# Altium schematic sheet PCB.SchDoc
size A; SheetNumber: 1; SheetTotal: 1
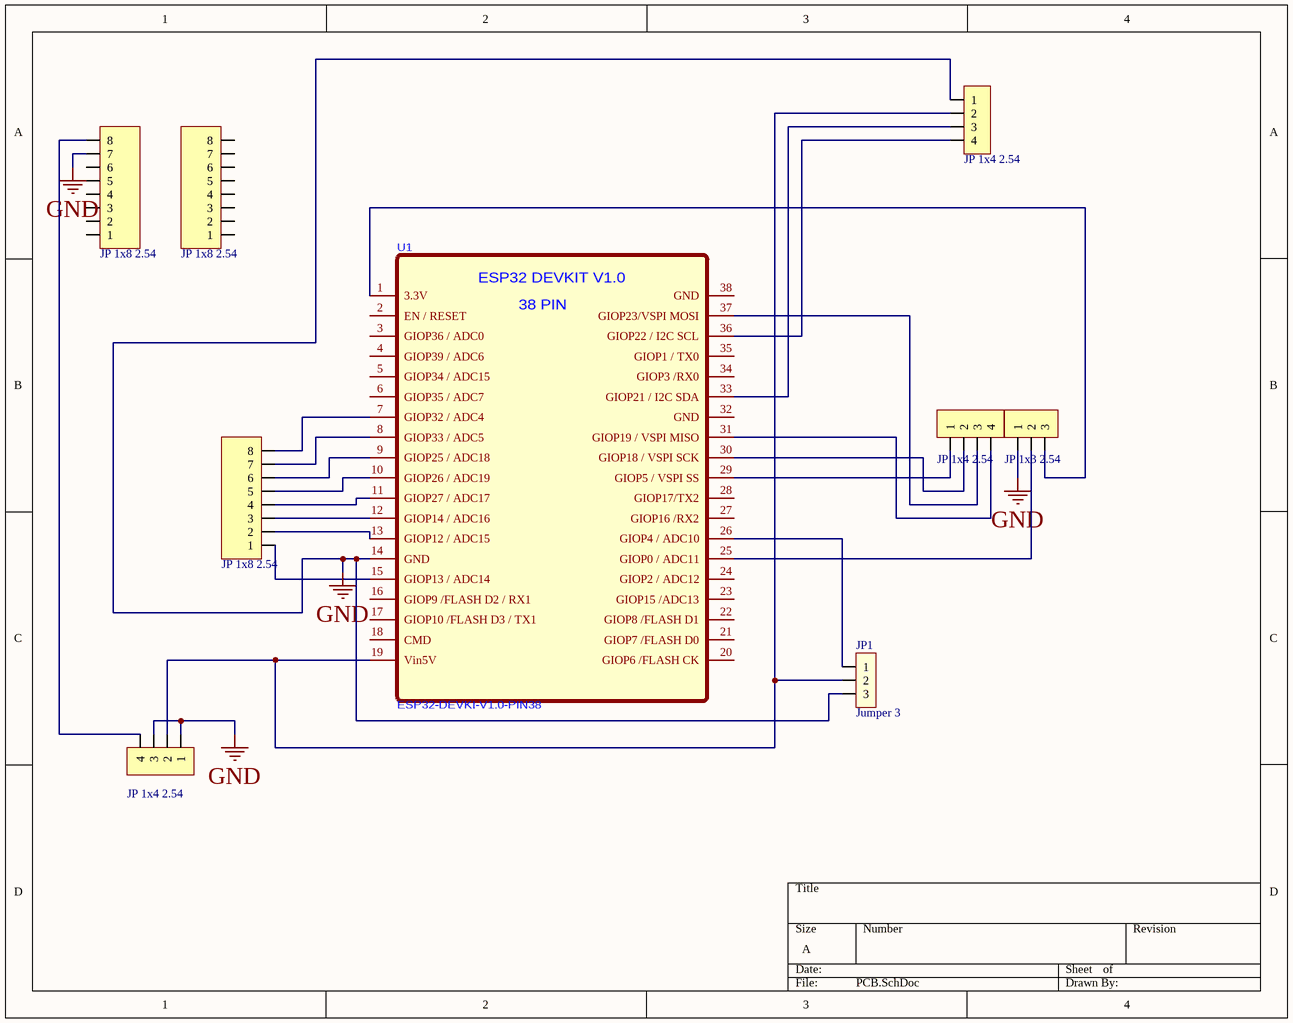
[diagram p0: PCB.SchDoc]

## Parts
JP1  Jumper 3  [JP3]
JP2  JP 1x4 2.54  [JP 1x4 DT]
JP3  JP 1x4 2.54  [JP 1x4 CT]
JP4  JP 1x3 2.54  [JP 1x3 CT]
JP5  JP 1x8 2.54  [JP 1x8 CT]
JP6  JP 1x8 2.54  [JP 1x8 CT]
JP8  JP 1x4 2.54  [JP 1x4 DT]
JP?  JP 1x8 2.54  [JP 1x8 DT]
U1  ESP32-DEVKI-V1.0-PIN38  [ESP32-DEVKIT-V1.0-38PIN]

## Nets
GND: JP1.3 JP2.1 JP4.1 JP5.7 JP8.1 JP8.3 U1.14(GND)
NetJP1_1: JP1.1 U1.26(GIOP4_/_ADC10)
NetJP1_2: JP1.2 JP2.2 JP8.2 U1.19(Vin5V)
NetJP2_3: JP2.3 U1.33(GIOP21_/_I2C_SDA)
NetJP2_4: JP2.4 U1.36(GIOP22_/_I2C_SCL)
NetJP3_1: JP3.1 U1.29(GIOP5_/_VSPI_SS)
NetJP3_2: JP3.2 U1.30(GIOP18_/_VSPI_SCK)
NetJP3_3: JP3.3 U1.37(GIOP23/VSPI_MOSI)
NetJP3_4: JP3.4 U1.31(GIOP19_/_VSPI_MISO)
NetJP4_2: JP4.2 U1.25(GIOP0_/_ADC11)
NetJP4_3: JP4.3 U1.1(3.3V)
NetJP5_8: JP5.8 JP8.4
NetJP?_1: JP?.1 U1.15(GIOP13_/_ADC14)
NetJP?_2: JP?.2 U1.13(GIOP12_/_ADC15)
NetJP?_3: JP?.3 U1.12(GIOP14_/_ADC16)
NetJP?_4: JP?.4 U1.11(GIOP27_/_ADC17)
NetJP?_5: JP?.5 U1.10(GIOP26_/_ADC19)
NetJP?_6: JP?.6 U1.9(GIOP25_/_ADC18)
NetJP?_7: JP?.7 U1.8(GIOP33_/_ADC5)
NetJP?_8: JP?.8 U1.7(GIOP32_/_ADC4)

Not connected (* = marked no-connect by the designer): JP5 1 2 3 4 5 6; JP6 1 2 3 4 5 6 7 8; U1 2(EN_/_RESET) 3(GIOP36_/_ADC0) 4(GIOP39_/_ADC6) 5(GIOP34_/_ADC15) 6(GIOP35_/_ADC7) 16(GIOP9_/FLASH_D2_/_RX1) 17(GIOP10_/FLASH_D3_/_TX1) 18(CMD) 20(GIOP6_/FLASH_CK) 21(GIOP7_/FLASH_D0) 22(GIOP8_/FLASH_D1) 23(GIOP15_/ADC13) 24(GIOP2_/_ADC12) 27(GIOP16_/RX2) 28(GIOP17/TX2) 32(GND) 34(GIOP3_/RX0) 35(GIOP1_/_TX0) 38(GND)

## Notes on the sheet
- (in symbol ESP32-DEVKI-V1.0-PIN38) ESP32 DEVKIT V1.0; 38 PIN

## Library data of the parts
JP1 = JP3_1: Value: J3
JP2 JP8 = JP 1x4 2.54 Duc Thang: Cắm; Ten_Linh_Kien: Jump Đơn Đực 2.54MM 1x40P Thẳng 11MM; Don_Vi: Con; Ma_Hang: MH000903; Ghi_Chu: *; Kieu_Chan: *; Chung_Loai: Cắm
JP3 = JP 1x4 2.54 Cai Thang: Cắm; Ten_Linh_Kien: Jump Đơn Cái 2.54MM 1x20P Thẳng; Don_Vi: Con; Ma_Hang: MH004006; Ghi_Chu: *; Kieu_Chan: *; Chung_Loai: Cắm
JP4 = JP 1x3 2.54 Cai Thang: Cắm; Ten_Linh_Kien: Jump Đơn Cái 2.54MM 1x20P Thẳng; Don_Vi: Con; Ma_Hang: MH004006; Ghi_Chu: *; Kieu_Chan: *; Chung_Loai: Cắm
JP5 JP6 = JP 1x8 2.54 Cai Thang: Cắm; Ten_Linh_Kien: Jump Đơn Cái 2.54MM 1x20P Thẳng; Don_Vi: Con; Ma_Hang: MH004006; Ghi_Chu: *; Kieu_Chan: *; Chung_Loai: Cắm
JP? = JP 1x8 2.54 Duc Thang: Cắm; Ten_Linh_Kien: Jump Đơn Đực 2.54MM 1x40P Thẳng 11MM; Don_Vi: Con; Ma_Hang: MH000903; Ghi_Chu: *; Kieu_Chan: *; Chung_Loai: Cắm